# Altium schematic sheet Power.SchDoc
size A; SheetNumber: 2; SheetTotal: 5
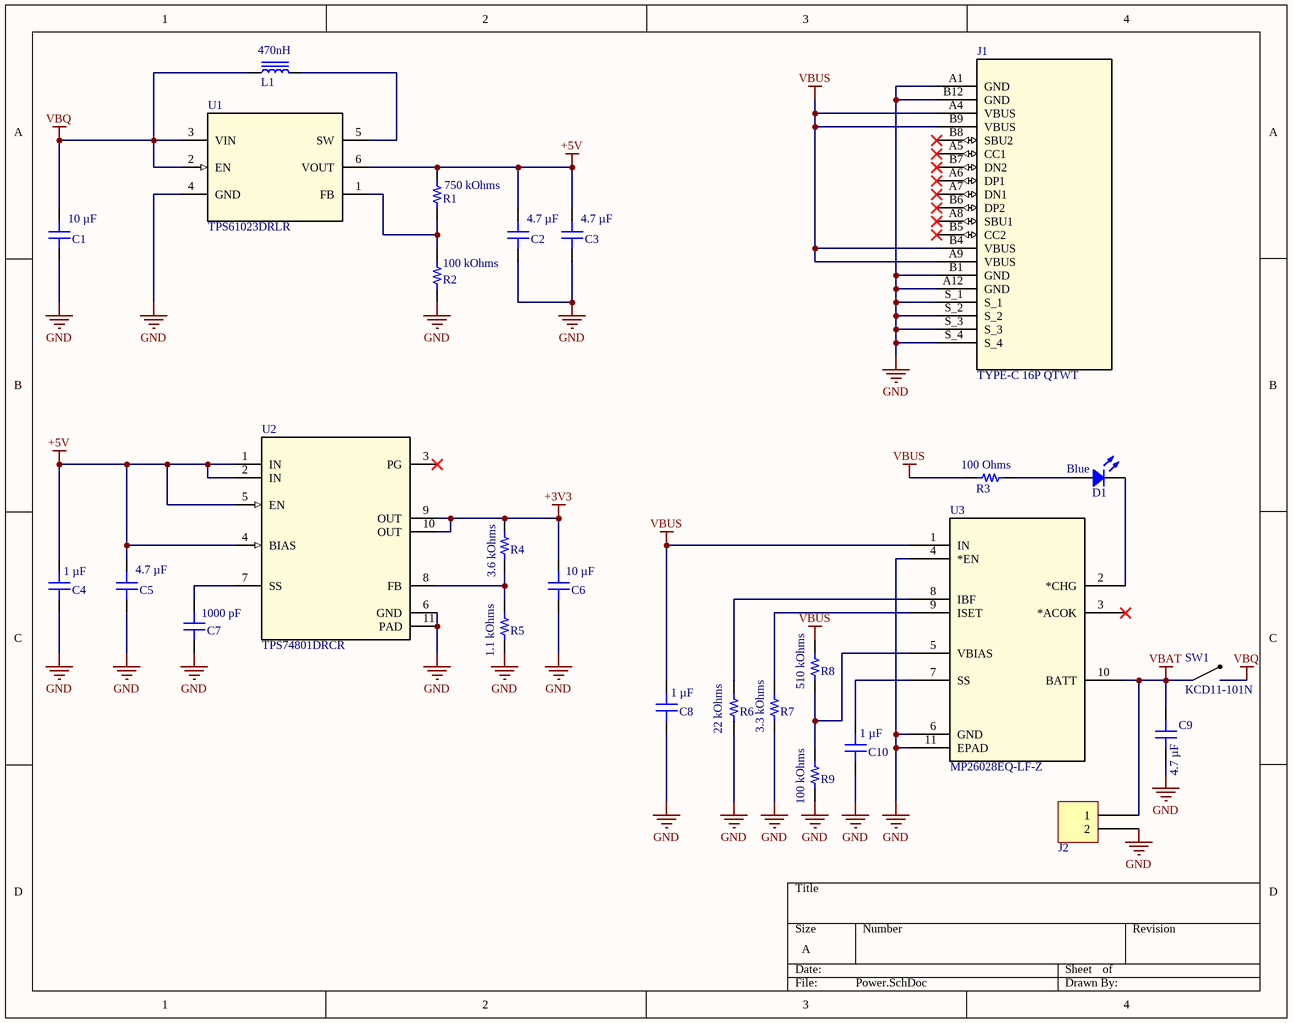
[diagram p0: Power.SchDoc]

## Parts
C1  10 µF  [CAP 0805_2012]
C2  4.7 µF  [CAP 0805_2012]
C3  4.7 µF  [CAP 0805_2012]
C4  1 µF  [CAP 0805_2012]
C5  4.7 µF  [CAP 0805_2012]
C6  10 µF  [CAP 0805_2012]
C7  1000 pF  [CAP 0603_1608]
C8  1 µF  [CAP 0805_2012]
C9  4.7 µF  [CAP 0805_2012]
C10  1 µF  [CAP 0805_2012]
D1  Blue  [LED 0805_2012 BLUE]
J1  TYPE-C 16P QTWT  [TYPE-C 16P QTWT]
J2  0022272021  [MOLEX KK 0022272021]  (value not drawn)
L1  470nH  [IND 1008_2520]
R1  750 kOhms  [RES 0805_2012]
R2  100 kOhms  [RES 0805_2012]
R3  100 Ohms  [RES 0805_2012]
R4  3.6 kOhms  [RES 0805_2012]
R5  1.1 kOhms  [RES 0805_2012]
R6  22 kOhms  [RES 0805_2012]
R7  3.3 kOhms  [RES 0805_2012]
R8  510 kOhms  [RES 0805_2012]
R9  100 kOhms  [RES 0805_2012]
SW1  KCD11-101N  [KCD11-101N]
U1  TPS61023DRLR  [DRL0006A]
U2  TPS74801DRCR  [DRC0010A]
U3  MP26028EQ-LF-Z  [IC10_MP26028_MNP]

## Nets
+3V3: C6.2 R4.2 U2.9(OUT) U2.10(OUT)
+5V: C2.2 C3.2 C4.2 C5.2 R1.1 U1.6(VOUT) U2.1(IN) U2.2(IN) U2.4(BIAS) U2.5(EN)
GND: C1.1 C2.1 C3.1 C4.1 C5.1 C6.1 C7.1 C8.1 C9.2 C10.1 J1.A1(GND) J1.A12(GND) J1.B1(GND) J1.B12(GND) J1.S_1 J1.S_2 J1.S_3 J1.S_4 J2.2 R2.1 R5.1 R6.1 R7.1 R9.1 U1.4(GND) U2.6(GND) U2.11(PAD) U3.4(*EN) U3.6(GND) U3.11(EPAD)
VBAT: C9.1 J2.1 SW1.1(CM) U3.10(BATT)
VBQ: C1.2 L1.1 SW1.2(NO) U1.2(EN) U1.3(VIN)
VBUS: C8.2 J1.A4(VBUS) J1.A9(VBUS) J1.B4(VBUS) J1.B9(VBUS) R3.2 R8.2 U3.1(IN)
NetC7_2: C7.2 U2.7(SS)
NetC10_2: C10.2 U3.7(SS)
NetD1_1: D1.1 R3.1
NetD1_2: D1.2 U3.2(*CHG)
NetL1_2: L1.2 U1.5(SW)
NetR1_2: R1.2 R2.2 U1.1(FB)
NetR4_1: R4.1 R5.2 U2.8(FB)
NetR6_2: R6.2 U3.8(IBF)
NetR7_2: R7.2 U3.9(ISET)
NetR8_1: R8.1 R9.2 U3.5(VBIAS)

Not connected (* = marked no-connect by the designer): J1 A5(CC1)* A6(DP1)* A7(DN1)* A8(SBU1)* B5(CC2)* B6(DP2)* B7(DN2)* B8(SBU2)*; U2 3(PG)*; U3 3(*ACOK)*

## Library data of the parts
C1 C6 = C2012X5R1V106K125AC: CAP CER 10UF 35V X5R 0805; Manufacturer: TDK Corporation; id: 6404; Tolerance: ±10%; Value: 10 µF; Temperature Coefficient: X5R; Part Number: C2012X5R1V106K125AC; Supplier Part Number 1: 445-14418-1-ND; ComponentLink2Description: DigiKey Link; Features: Low ESL; ComponentLink1URL: https:\\product.tdk.com\info\en\catalog\datasheets\mlcc_commercial_general_en.pdf?ref_disty=digikey; PartId: 40531; Supplier 1: DigiKey; Series: C; LastUpdated: 2023-01-03T20:10:34.680; Part Status: Active; Capacitance: 10 µF; Device Package: 0805 (2012 Metric); Thickness (Max): 0.057" (1.45mm); Voltage - Rated: 35V; Minimum Order: 1; Packaging: TapeAndReel; Applications: General Purpose; Package / Case: 0805 (2012 Metric); ComponentLink1Description: Datasheet; Price: 0.14; ComponentLink2URL: https:\\www.digikey.com\en\products\detail\tdk-corporation\C2012X5R1V106K125AC\3951654; Lifecycle Status: Active; Operating Temperature: -55°C ~ 85°C; Size / Dimension: 0.079" L x 0.049" W (2.00mm x 1.25mm); Mounting Type: Surface Mount, MLCC
C2 C3 C5 C9 = C2012X5R1H475K125AB: CAP CER 4.7UF 50V X5R 0805; Manufacturer: TDK Corporation; id: 2789; Tolerance: ±10%; Value: 4.7 µF; Temperature Coefficient: X5R; Part Number: C2012X5R1H475K125AB; Supplier Part Number 1: 445-5980-1-ND; ComponentLink2Description: DigiKey Link; Features: Low ESL; ComponentLink1URL: https:\\product.tdk.com\info\en\catalog\datasheets\mlcc_commercial_general_en.pdf?ref_disty=digikey; PartId: 15315; Supplier 1: DigiKey; Series: C; LastUpdated: 2023-01-03T20:10:23.257; Part Status: Active; Capacitance: 4.7 µF; Device Package: 0805 (2012 Metric); Thickness (Max): 0.057" (1.45mm); Voltage - Rated: 50V; Minimum Order: 1; Packaging: TapeAndReel; Applications: General Purpose; Package / Case: 0805 (2012 Metric); ComponentLink1Description: Datasheet; Price: 0.09; ComponentLink2URL: https:\\www.digikey.com\en\products\detail\tdk-corporation\C2012X5R1H475K125AB\2443458; Lifecycle Status: Active; Operating Temperature: -55°C ~ 85°C; Size / Dimension: 0.079" L x 0.049" W (2.00mm x 1.25mm); Mounting Type: Surface Mount, MLCC
C4 C8 C10 = C2012X7R1H105K125AB: CAP CER 1UF 50V X7R 0805; Manufacturer: TDK Corporation; id: 6079; Tolerance: ±10%; Part Number: C2012X7R1H105K125AB; Value: 1 µF; Temperature Coefficient: X7R; Supplier Part Number 1: 445-7547-1-ND; ComponentLink2Description: DigiKey Link; Features: Low ESL; ComponentLink1URL: https:\\product.tdk.com\info\en\catalog\datasheets\mlcc_commercial_general_en.pdf?ref_disty=digikey; PartId: 39229; Supplier 1: DigiKey; Series: C; LastUpdated: 2023-01-03T20:10:09.350; Part Status: Active; Capacitance: 1 µF; Device Package: 0805 (2012 Metric); Thickness (Max): 0.057" (1.45mm); Voltage - Rated: 50V; Minimum Order: 1; Packaging: TapeAndReel; Applications: General Purpose; Package / Case: 0805 (2012 Metric); ComponentLink1Description: Datasheet; Price: 0.05; ComponentLink2URL: https:\\www.digikey.com\en\products\detail\tdk-corporation\C2012X7R1H105K125AB\2732982; Lifecycle Status: Active; Operating Temperature: -55°C ~ 125°C; Size / Dimension: 0.079" L x 0.049" W (2.00mm x 1.25mm); Mounting Type: Surface Mount, MLCC
C7 = C1608NP02A102J080AA: CAP CER 1000PF 100V NP0 0603; Manufacturer: TDK Corporation; id: 4166; Temperature Coefficient: C0G, NP0; Tolerance: ±5%; Part Number: C1608NP02A102J080AA; Value: 1000 pF; Supplier Part Number 1: 445-14106-1-ND; ComponentLink2Description: DigiKey Link; Features: High Temperature; ComponentLink1URL: https:\\product.tdk.com\info\en\catalog\datasheets\mlcc_commercial_hightemp_en.pdf?ref_disty=digikey; PartId: 17647; Supplier 1: DigiKey; Series: C; LastUpdated: 2023-01-03T20:07:00.130; Part Status: Active; Capacitance: 1000 pF; Device Package: 0603 (1608 Metric); Thickness (Max): 0.035" (0.90mm); Voltage - Rated: 100V; Minimum Order: 1; Packaging: TapeAndReel; Applications: General Purpose; Package / Case: 0603 (1608 Metric); ComponentLink1Description: Datasheet; Price: 0.03; ComponentLink2URL: https:\\www.digikey.com\en\products\detail\tdk-corporation\C1608NP02A102J080AA\3951342; Lifecycle Status: Active; Operating Temperature: -55°C ~ 150°C; Size / Dimension: 0.063" L x 0.031" W (1.60mm x 0.80mm); Mounting Type: Surface Mount, MLCC
D1 = 5975606507F: LED BLUE 0805 SMD; Manufacturer: Dialight; id: 753; Lens Color: 0.93mm; Lens Style: Rectangle with Flat Top; Lens Size: 1.40mm x 1.24mm; Configuration: Standard; Wavelength - Dominant: 470nm; Voltage - Forward (Vf) (Typ): 2.9V; Current - Test: 5mA; Millicandela Rating: 36mcd; Part Number: 5975606507F; Supplier Part Number 1: 350-4390-1-ND; Supplier Device Package: 0805; ComponentLink1Description: Datasheet; Color: Blue; ComponentLink2URL: https:\\www.digikey.com\en\products\detail\dialight\5975606507F\9385445; ComponentLink1URL: http:\\www.dialightsignalsandcomponents.com\Assets\Drawings\2D_Drawings_DrawingDetailedSpec\NewDrawings\18370A.pdf; Supplier 1: DigiKey; Series: 597; Height (Max): 0.93mm; Part Status: Active; ComponentLink2Description: DigiKey Link; Device Package: 0805 (2012 Metric); Packaging: TapeAndReel; Minimum Order: 1; Package / Case: 0805 (2012 Metric); PartId: 753; Lifecycle Status: Active; LastUpdated: 2023-01-02T20:56:19; Value: Blue; Size / Dimension: 2.00mm L x 1.25mm W; Mounting Type: Surface Mount; Price: 0.14
J1 = TYPE-C 16P QTWT: USB Type-C Female Connector USB 3, Right Angle, 16P 3A 1 Ports; Manufacturer_Name: SHOUHAN; Manufacturer_Part_Number: TYPE-C 16P QTWT
J2 = 0022272021: CONN HEADER VERT 2POS 2.54MM; Manufacturer: Molex; id: 76; Style: Board to Cable\Wire; Contact Length - Mating: 0.295" (7.49mm); Pitch - Mating: 0.100" (2.54mm); Number Of Positions: 2; Number Of Positions Loaded: All; Shrouding: Shrouded - 1 Wall; Material Flammability Rating: UL94 V-0; Overall Contact Length: 0.560" (14.22mm); Contact Length - Post: 0.140" (3.56mm); Part Number: 0022272021; Supplier Part Number 1: WM4111-ND; Contact Shape: Square; Termination: Solder; ComponentLink1Description: Datasheet; Connector Type: Header; Contact Material: Brass; ComponentLink2URL: http:\\digikey.com\product-detail\en\molex\0022272021\WM4111-ND\1130577; Contact Finish - Mating: Tin; ComponentLink1URL: https:\\www.molex.com\pdm_docs\sd\022272021_sd.pdf; Fastening Type: Friction Lock; Supplier 1: DigiKey; Number Of Rows: 1; Series: KK 6410; Part Status: Active; ComponentLink2Description: DigiKey Link; Contact Type: Male Pin; Packaging: Bulk; Insulation Height: 0.461" (11.70mm); Contact Finish - Post: Tin; Contact Finish Thickness - Mating: 100.0µin (2.54µm); Minimum Order: 1; PartId: 76; Lifecycle Status: Active; LastUpdated: 2020-01-12T23:51:43.453; Insulation Color: Natural; Mounting Type: Through Hole; Insulation Material: Polyamide (PA), Nylon; Price: 0.27
L1 = DFE252010P-R47M=P2: FIXED IND 470NH 5A 35 MOHM SMD; Part Number: DFE252012F-R47M=P2; Manufacturer: Murata Electronics; id: 3453; Tolerance: ±20%; Type: Wirewound; Inductance Frequency - Test: 1MHz; Material - Core: Iron Powder; DC Resistance (DCR): 35mOhm Max; Shielding: Shielded; Height - Seated (Max): 0.039" (1.00mm); Supplier Part Number 1: 490-10641-1-ND; Current Rating (Amps): 5A; Supplier Device Package: 1008 (2520 Metric); Inductance: 470nH; ComponentLink1Description: Datasheet; ComponentLink2URL: http:\\digikey.com\product-detail\en\murata-electronics\DFE252010P-R47M=P2\490-10641-1-ND\5272069; ComponentLink1URL: https:\\www.murata.com\~\media\webrenewal\products\inductor\chip\tokoproducts\wirewoundmetalalloychiptype\m_dfe252010p.ashx; Supplier 1: DigiKey; Series: DFE252010P; Part Status: Active; ComponentLink2Description: DigiKey Link; Device Package: 1008 (2520 Metric); Packaging: TapeAndReel; Minimum Order: 1; Package / Case: 1008 (2520 Metric); PartId: 3481; Lifecycle Status: Active; LastUpdated: 2022-03-24T14:40:41.850; Operating Temperature: -40°C ~ 125°C; Value: 470nH; Size / Dimension: 0.098" L x 0.079" W (2.50mm x 2.00mm); Mounting Type: Surface Mount; Price: 0.16
R1 = RMCF0805FT750K: RES 750K OHM 1% 1\8W 0805; Manufacturer: Stackpole Electronics Inc; id: 88; Temperature Coefficient: ±100ppm\°C; Power (Watts): 0.125W, 1\8W; Height - Seated (Max): 0.026" (0.65mm); Part Number: RMCF0805FT750K; Supplier Part Number 1: RMCF0805FT750KCT-ND; Supplier Device Package: 0805; ComponentLink1Description: Datasheet; ComponentLink2URL: https:\\www.digikey.com\en\products\detail\stackpole-electronics-inc\RMCF0805FT750K\1760532; Features: Automotive AEC-Q200; ComponentLink1URL: https:\\www.seielect.com\catalog\sei-rmcf_rmcp.pdf; Composition: Thick Film; Tolerance: ±1%; Supplier 1: DigiKey; Series: RMCF; Part Status: Active; ComponentLink2Description: DigiKey Link; Device Package: 0805 (2012 Metric); Packaging: CutTape; Ratings: AEC-Q200; Minimum Order: 1; Package / Case: 0805 (2012 Metric); PartId: 27859; Lifecycle Status: Active; LastUpdated: 2023-01-02T20:44:51.690; Operating Temperature: -55°C ~ 155°C; Number Of Terminations: 2; Value: 750 kOhms; Size / Dimension: 0.079" L x 0.049" W (2.00mm x 1.25mm); Price: 0.01; Resistance: 750 kOhms
R2 R9 = CRGP0805F100K: RES 100K OHM 1% 1\3W 0805; Manufacturer: TE Connectivity Passive Product; id: 527; Temperature Coefficient: ±100ppm\°C; Power (Watts): 0.333W, 1\3W; Height - Seated (Max): 0.026" (0.65mm); Part Number: CRGP0805F100K; Supplier Part Number 1: A130501CT-ND; Supplier Device Package: 0805; ComponentLink1Description: Datasheet; ComponentLink2URL: https:\\www.digikey.com\en\products\detail\te-connectivity-passive-product\CRGP0805F100K\8577103; Features: Pulse Withstanding; ComponentLink1URL: https:\\www.te.com\commerce\DocumentDelivery\DDEController?Action=srchrtrv&DocNm=9-1773463-9&DocType=DS&DocLang=English; Composition: Thick Film; Tolerance: ±1%; Supplier 1: DigiKey; Series: CRGP; Part Status: Active; ComponentLink2Description: DigiKey Link; Device Package: 0805 (2012 Metric); Packaging: TapeAndReel; Minimum Order: 1; Package / Case: 0805 (2012 Metric); PartId: 28747; Lifecycle Status: Active; LastUpdated: 2023-01-02T20:44:47.767; Operating Temperature: -55°C ~ 155°C; Number Of Terminations: 2; Value: 100 kOhms; Size / Dimension: 0.079" L x 0.049" W (2.00mm x 1.25mm); Price: 0.02; Resistance: 100 kOhms
R3 = RNCS0805BKE100R: RES 100 OHM 0.1% 1\10W 0805; Manufacturer: Stackpole Electronics Inc; id: 1341; Temperature Coefficient: ±25ppm\°C; Power (Watts): 0.1W, 1\10W; Part Number: RNCS0805BKE100R; Height - Seated (Max): 0.026" (0.65mm); Supplier Part Number 1: RNCS0805BKE100RCT-ND; Supplier Device Package: 0805; ComponentLink1Description: Datasheet; ComponentLink2URL: https:\\www.digikey.com\en\products\detail\stackpole-electronics-inc\RNCS0805BKE100R\1800065; Features: Anti-Corrosive, Automotive AEC-Q200, Moisture Resistant; ComponentLink1URL: https:\\www.seielect.com\catalog\sei-rncs_rnch.pdf; Composition: Thin Film; Tolerance: ±0.1%; Supplier 1: DigiKey; Series: RNCS; Part Status: Active; ComponentLink2Description: DigiKey Link; Device Package: 0805 (2012 Metric); Packaging: TapeAndReel; Ratings: AEC-Q200; Minimum Order: 1; Package / Case: 0805 (2012 Metric); PartId: 30410; Lifecycle Status: Active; LastUpdated: 2023-01-02T20:44:41.260; Operating Temperature: -55°C ~ 155°C; Number Of Terminations: 2; Value: 100 Ohms; Size / Dimension: 0.079" L x 0.049" W (2.00mm x 1.25mm); Price: 0.09; Resistance: 100 Ohms
R4 = RMCF0805FT3K60: RES 3.6K OHM 1% 1\8W 0805; Manufacturer: Stackpole Electronics Inc; id: 2405; Temperature Coefficient: ±100ppm\°C; Power (Watts): 0.125W, 1\8W; Part Number: RMCF0805FT3K60; Height - Seated (Max): 0.026" (0.65mm); Supplier Part Number 1: RMCF0805FT3K60CT-ND; Supplier Device Package: 0805; ComponentLink1Description: Datasheet; ComponentLink2URL: https:\\www.digikey.com\en\products\detail\stackpole-electronics-inc\RMCF0805FT3K60\1712987; Features: Automotive AEC-Q200; ComponentLink1URL: https:\\www.seielect.com\catalog\sei-rmcf_rmcp.pdf; Composition: Thick Film; Tolerance: ±1%; Supplier 1: DigiKey; Series: RMCF; Part Status: Active; ComponentLink2Description: DigiKey Link; Device Package: 0805 (2012 Metric); Packaging: CutTape; Ratings: AEC-Q200; Minimum Order: 1; Package / Case: 0805 (2012 Metric); PartId: 32503; Lifecycle Status: Active; LastUpdated: 2023-01-02T20:44:32.503; Operating Temperature: -55°C ~ 155°C; Number Of Terminations: 2; Value: 3.6 kOhms; Size / Dimension: 0.079" L x 0.049" W (2.00mm x 1.25mm); Price: 0.01; Resistance: 3.6 kOhms
R5 = RMCF0805FG1K10: RES 1.1K OHM 1% 1\8W 0805; Manufacturer: Stackpole Electronics Inc; id: 606; Temperature Coefficient: ±100ppm\°C; Power (Watts): 0.125W, 1\8W; Part Number: RMCF0805FG1K10; Height - Seated (Max): 0.026" (0.65mm); Supplier Part Number 1: RMCF0805FG1K10CT-ND; Supplier Device Package: 0805; ComponentLink1Description: Datasheet; ComponentLink2URL: https:\\www.digikey.com\en\products\detail\stackpole-electronics-inc\RMCF0805FG1K10\1760461; Features: Automotive AEC-Q200; ComponentLink1URL: https:\\www.seielect.com\catalog\sei-rmcf_rmcp.pdf; Composition: Thick Film; Tolerance: ±1%; Supplier 1: DigiKey; Series: RMCF; Part Status: Active; ComponentLink2Description: DigiKey Link; Device Package: 0805 (2012 Metric); Packaging: CutTape; Ratings: AEC-Q200; Minimum Order: 1; Package / Case: 0805 (2012 Metric); PartId: 28907; Lifecycle Status: Active; LastUpdated: 2023-01-02T20:44:47.117; Operating Temperature: -55°C ~ 155°C; Number Of Terminations: 2; Value: 1.1 kOhms; Size / Dimension: 0.079" L x 0.049" W (2.00mm x 1.25mm); Price: 0.01; Resistance: 1.1 kOhms
R6 = RMCF0805FT22K0: RES 22K OHM 1% 1\8W 0805; Manufacturer: Stackpole Electronics Inc; id: 2357; Temperature Coefficient: ±100ppm\°C; Power (Watts): 0.125W, 1\8W; Part Number: RMCF0805FT22K0; Height - Seated (Max): 0.026" (0.65mm); Supplier Part Number 1: RMCF0805FT22K0CT-ND; Supplier Device Package: 0805; ComponentLink1Description: Datasheet; ComponentLink2URL: https:\\www.digikey.com\en\products\detail\stackpole-electronics-inc\RMCF0805FT22K0\1760246; Features: Automotive AEC-Q200; ComponentLink1URL: https:\\www.seielect.com\catalog\sei-rmcf_rmcp.pdf; Composition: Thick Film; Tolerance: ±1%; Supplier 1: DigiKey; Series: RMCF; Part Status: Active; ComponentLink2Description: DigiKey Link; Device Package: 0805 (2012 Metric); Packaging: CutTape; Ratings: AEC-Q200; Minimum Order: 1; Package / Case: 0805 (2012 Metric); PartId: 32406; Lifecycle Status: Active; LastUpdated: 2023-01-02T20:44:32.837; Operating Temperature: -55°C ~ 155°C; Number Of Terminations: 2; Value: 22 kOhms; Size / Dimension: 0.079" L x 0.049" W (2.00mm x 1.25mm); Price: 0.01; Resistance: 22 kOhms
R7 = RMCF0805FT3K30: RES 3.3K OHM 1% 1\8W 0805; Manufacturer: Stackpole Electronics Inc; id: 2398; Temperature Coefficient: ±100ppm\°C; Power (Watts): 0.125W, 1\8W; Part Number: RMCF0805FT3K30; Height - Seated (Max): 0.026" (0.65mm); Supplier Part Number 1: RMCF0805FT3K30CT-ND; Supplier Device Package: 0805; ComponentLink1Description: Datasheet; ComponentLink2URL: https:\\www.digikey.com\en\products\detail\stackpole-electronics-inc\RMCF0805FT3K30\1760325; Features: Automotive AEC-Q200; ComponentLink1URL: https:\\www.seielect.com\catalog\sei-rmcf_rmcp.pdf; Composition: Thick Film; Tolerance: ±1%; Supplier 1: DigiKey; Series: RMCF; Part Status: Active; ComponentLink2Description: DigiKey Link; Device Package: 0805 (2012 Metric); Packaging: CutTape; Ratings: AEC-Q200; Minimum Order: 1; Package / Case: 0805 (2012 Metric); PartId: 32489; Lifecycle Status: Active; LastUpdated: 2023-01-02T20:44:32.553; Operating Temperature: -55°C ~ 155°C; Number Of Terminations: 2; Value: 3.3 kOhms; Size / Dimension: 0.079" L x 0.049" W (2.00mm x 1.25mm); Price: 0.01; Resistance: 3.3 kOhms
R8 = RMCF0805FT510K: RES 510K OHM 1% 1\8W 0805; Manufacturer: Stackpole Electronics Inc; id: 909; Temperature Coefficient: ±100ppm\°C; Power (Watts): 0.125W, 1\8W; Part Number: RMCF0805FT510K; Height - Seated (Max): 0.026" (0.65mm); Supplier Part Number 1: RMCF0805FT510KCT-ND; Supplier Device Package: 0805; ComponentLink1Description: Datasheet; ComponentLink2URL: https:\\www.digikey.com\en\products\detail\stackpole-electronics-inc\RMCF0805FT510K\1713215; Features: Automotive AEC-Q200; ComponentLink1URL: https:\\www.seielect.com\catalog\sei-rmcf_rmcp.pdf; Composition: Thick Film; Tolerance: ±1%; Supplier 1: DigiKey; Series: RMCF; Part Status: Active; ComponentLink2Description: DigiKey Link; Device Package: 0805 (2012 Metric); Packaging: CutTape; Ratings: AEC-Q200; Minimum Order: 1; Package / Case: 0805 (2012 Metric); PartId: 29516; Lifecycle Status: Active; LastUpdated: 2023-01-02T20:44:44.913; Operating Temperature: -55°C ~ 155°C; Number Of Terminations: 2; Value: 510 kOhms; Size / Dimension: 0.079" L x 0.049" W (2.00mm x 1.25mm); Price: 0.01; Resistance: 510 kOhms
SW1 = KCD11-101N: Rocker Switch SPST; Manufacturer Name: Non-Brand; Manufacturer Part Number: KCD1-2-(3A 250V AC)
U1 = TPS61023DRLR: Boost Switching Regulator IC Positive Adjustable 2.2V 1 Output 3A SOT-563, SOT-666; Manufacturer Name: Texas Instruments; Manufacturer Part Number: TPS61023DRLR
U2 = TPS74801DRCR: Linear Voltage Regulator IC Positive Adjustable 1 Output 1.5A 10-VSON (3x3); Manufacturer Name: Texas Instruments; Manufacturer Part Number: TPS74801DRCR; Application_BuildNumber: *; PackageReference: DRC0010A; MountType: SMT; CompType: IC; RoHS: Y; Manufacturer: Texas Instruments
U3 = MP26028EQ-LF-Z: 1A Linear Li-Ion Battery Charger with Trickle Charge; Manufacturer Name: Monolithic Power Systems; Manufacturer Part Number: MP26028EQ-LF-Z